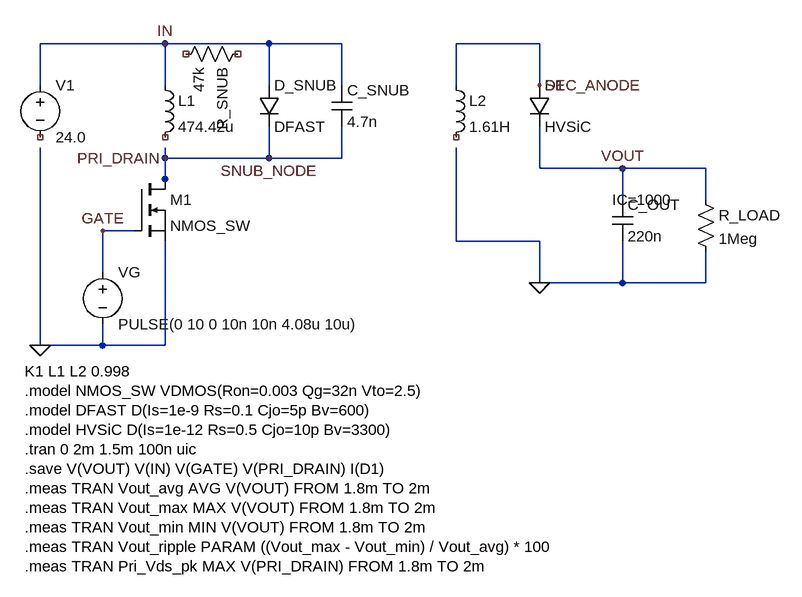
[diagram p0: schematic gen_flyback.asc]
gen_flyback.asc, the LTspice schematic file:
Version 4
SHEET 1 1440 900
WIRE 64 80 64 16
WIRE 64 16 256 16
WIRE 256 16 256 80
WIRE 256 16 416 16
WIRE 416 16 416 80
WIRE 416 16 528 16
WIRE 528 16 528 80
WIRE 64 176 64 480
WIRE 256 176 256 224
WIRE 416 144 416 192
WIRE 416 192 256 192
WIRE 256 192 256 224
WIRE 528 144 528 192
WIRE 528 192 416 192
WIRE 208 304 160 304
WIRE 160 304 160 368
WIRE 160 448 160 480
WIRE 256 320 256 480
WIRE 64 480 160 480
WIRE 160 480 256 480
WIRE 704 80 704 16
WIRE 704 16 832 16
WIRE 832 16 832 80
WIRE 704 176 704 320
WIRE 704 320 832 320
WIRE 832 144 832 208
WIRE 832 208 960 208
WIRE 960 208 960 256
WIRE 960 320 960 384
WIRE 1088 208 1088 256
WIRE 960 208 1088 208
WIRE 1088 336 1088 384
WIRE 960 384 1088 384
WIRE 832 320 832 384
WIRE 832 384 960 384
FLAG 64 480 0
FLAG 832 384 0
FLAG 256 16 IN
FLAG 256 192 PRI_DRAIN
FLAG 160 304 GATE
FLAG 832 80 SEC_ANODE
FLAG 960 208 VOUT
FLAG 416 192 SNUB_NODE
SYMBOL voltage 64 64 R0
WINDOW 123 0 0 Left 2
WINDOW 39 0 0 Left 2
SYMATTR InstName V1
SYMATTR Value 24.0
SYMBOL voltage 160 352 R0
WINDOW 123 0 0 Left 2
WINDOW 39 0 0 Left 2
SYMATTR InstName VG
SYMATTR Value PULSE(0 10 0 10n 10n 4.08u 10u)
SYMBOL ind 240 64 R0
WINDOW 123 0 0 Left 2
WINDOW 39 0 0 Left 2
SYMATTR InstName L1
SYMATTR Value 474.42u
SYMBOL ind 688 64 R0
WINDOW 123 0 0 Left 2
WINDOW 39 0 0 Left 2
SYMATTR InstName L2
SYMATTR Value 1.61H
SYMBOL nmos 208 224 R0
WINDOW 123 0 0 Left 2
WINDOW 39 0 0 Left 2
SYMATTR InstName M1
SYMATTR Value NMOS_SW
SYMATTR Prefix M
SYMBOL diode 400 80 R0
WINDOW 123 0 0 Left 2
WINDOW 39 0 0 Left 2
SYMATTR InstName D_SNUB
SYMATTR Value DFAST
SYMBOL cap 512 80 R0
WINDOW 123 0 0 Left 2
WINDOW 39 0 0 Left 2
SYMATTR InstName C_SNUB
SYMATTR Value 4.7n
SYMBOL res 384 16 R90
WINDOW 123 0 0 Left 2
WINDOW 39 0 0 Left 2
SYMATTR InstName R_SNUB
SYMATTR Value 47k
SYMBOL cap 944 256 R0
WINDOW 123 0 0 Left 2
WINDOW 39 0 0 Left 2
SYMATTR InstName C_OUT
SYMATTR Value 220n
SYMATTR SpiceLine IC=1000
SYMBOL res 1072 240 R0
WINDOW 123 0 0 Left 2
WINDOW 39 0 0 Left 2
SYMATTR InstName R_LOAD
SYMATTR Value 1Meg
SYMBOL diode 816 80 R0
WINDOW 123 0 0 Left 2
WINDOW 39 0 0 Left 2
SYMATTR InstName D1
SYMATTR Value HVSiC
TEXT 40 520 Left 2 !K1 L1 L2 0.998
TEXT 40 550 Left 2 !.model NMOS_SW VDMOS(Ron=0.003 Qg=32n Vto=2.5)
TEXT 40 580 Left 2 !.model DFAST D(Is=1e-9 Rs=0.1 Cjo=5p Bv=600)
TEXT 40 610 Left 2 !.model HVSiC D(Is=1e-12 Rs=0.5 Cjo=10p Bv=3300)
TEXT 40 640 Left 2 !.tran 0 2m 1.5m 100n uic
TEXT 40 670 Left 2 !.save V(VOUT) V(IN) V(GATE) V(PRI_DRAIN) I(D1)
TEXT 40 700 Left 2 !.meas TRAN Vout_avg AVG V(VOUT) FROM 1.8m TO 2m
TEXT 40 730 Left 2 !.meas TRAN Vout_max MAX V(VOUT) FROM 1.8m TO 2m
TEXT 40 760 Left 2 !.meas TRAN Vout_min MIN V(VOUT) FROM 1.8m TO 2m
TEXT 40 790 Left 2 !.meas TRAN Vout_ripple PARAM ((Vout_max - Vout_min) / Vout_avg) * 100
TEXT 40 820 Left 2 !.meas TRAN Pri_Vds_pk MAX V(PRI_DRAIN) FROM 1.8m TO 2m

The netlist it stands for:
* gen_flyback.asc
V1 IN NC_01 24.0
VG GATE 0 PULSE(0 10 0 10n 10n 4.08u 10u)
L1 IN NC_02 474.42u
L2 SEC_ANODE NC_03 1.61H
M1 SNUB_NODE GATE 0 0 NMOS_SW
D_SNUB IN SNUB_NODE DFAST
C_SNUB IN SNUB_NODE 4.7n
R_SNUB NC_04 NC_05 47k
C_OUT VOUT 0 220n IC=1000
R_LOAD VOUT 0 1Meg
D1 SEC_ANODE VOUT HVSiC
.model D D
.lib standard.dio
.model NMOS NMOS
.model PMOS PMOS
.lib standard.mos
K1 L1 L2 0.998
.model NMOS_SW VDMOS(Ron=0.003 Qg=32n Vto=2.5)
.model DFAST D(Is=1e-9 Rs=0.1 Cjo=5p Bv=600)
.model HVSiC D(Is=1e-12 Rs=0.5 Cjo=10p Bv=3300)
.tran 0 2m 1.5m 100n uic
.save V(VOUT) V(IN) V(GATE) V(PRI_DRAIN) I(D1)
.meas TRAN Vout_avg AVG V(VOUT) FROM 1.8m TO 2m
.meas TRAN Vout_max MAX V(VOUT) FROM 1.8m TO 2m
.meas TRAN Vout_min MIN V(VOUT) FROM 1.8m TO 2m
.meas TRAN Vout_ripple PARAM ((Vout_max - Vout_min) / Vout_avg) * 100
.meas TRAN Pri_Vds_pk MAX V(PRI_DRAIN) FROM 1.8m TO 2m
.backanno
.end